# Altium schematic sheet LED-Driver-Sheet.SchDoc
size A4; DocumentNumber: 4; SheetNumber: 4; SheetTotal: 5
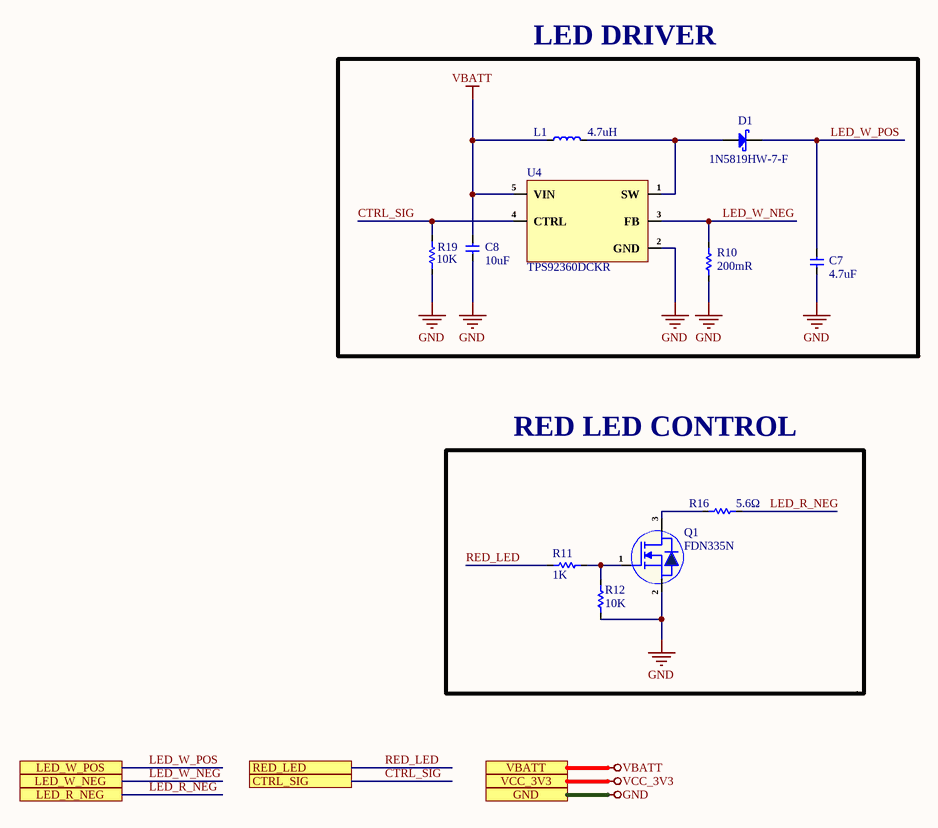
[diagram p0: LED-Driver-Sheet.SchDoc]

## Parts
C7  4.7uF  [Cap-0402]
C8  10uF  [Cap-0402]
D1  1N5819HW-7-F  [SOD-123]
L1  4.7uH  [IND-1210_]
Q1  FDN335N  [SOT-23]
R10  200mR  [Res-1206]
R11  1K  [Res-0402]
R12  10K  [Res-0402]
R16  5.6Ω  [Res-1206]
R19  10K  [Res-0402]
U4  TPS92360DCKR  [SC70-5]

## Blocks framed on the sheet
LED DRIVER: C7 C8 D1 L1 R10 R19 U4
RED LED CONTROL: Q1 R11 R12 R16

## Ports
CTRL_SIG (see Top-Sheet[3B], Controller-Sheet[1D]), GND (see Top-Sheet[2A], Connector-Sheet[2D], Controller-Sheet[2D], Power-Sheet[4C]), LED_R_NEG (see Top-Sheet[2B], Connector-Sheet[1D]), LED_W_NEG (see Top-Sheet[2B], Connector-Sheet[1D]), LED_W_POS (see Top-Sheet[2B], Connector-Sheet[1D]), RED_LED (see Top-Sheet[3B], Controller-Sheet[1D]), VBATT (see Top-Sheet[2A], Connector-Sheet[2D], Controller-Sheet[2D], Power-Sheet[4C]), VCC_3V3 (see Top-Sheet[2A], Controller-Sheet[2D], Power-Sheet[4C])

## Nets
GND: C7.1 C8.1 Q1.2(S) R10.1 R12.2 R19.1 U4.2(GND) ; port GND
VBATT: C8.2 L1.1 U4.5(VIN) ; port VBATT
VCC_3V3: port VCC_3V3
CTRL_SIG: R19.2 U4.4(CTRL) ; port CTRL_SIG
LED_R_NEG: R16.2 ; port LED_R_NEG
LED_W_NEG: R10.2 U4.3(FB) ; port LED_W_NEG
LED_W_POS: C7.2 D1.2(K) ; port LED_W_POS
RED_LED: R11.1 ; port RED_LED
NetD1_1: D1.1(A) L1.2 U4.1(SW)
NetQ1_1: Q1.1(G) R11.2 R12.1
NetQ1_3: Q1.3(D) R16.1

## Notes on the sheet
- File:
- Title:
- Date:
- Page
- Num:
- Total:
- Drawn By: Huzaifa Ali

## Library data of the parts
C7 = CL05A475MO5NUNC: CAP CER 4.7UF 16V X5R 0402; Manufacturer: Samsung; Material: 4241ConductorMaterial; Tolerance: 20%; Supplier 1: Avnet; Manufacturer Part Number: CL05A475MO5NUNC; RoHS: Yes; Category: Ceramic Capacitors; Stock 1: 50000; Pricing 1: 10000=0.09712 (USD); Mount: Surface Mount; Case/Package: 0402; Case Code (Metric): 1005; Case Code (Imperial): 0402; Min Operating Temperature: -55°C; Max Operating Temperature: 85°C; Packaging: Cut Tape; Capacitance: 4.7uF; Voltage Rating: 16V; Series: CL; Voltage Rating (DC): 16V; Length: 0.039inch; Width: 0.02inch; Height: 550um; Thickness: 0.022inch; RoHS Compliant: Yes; ComponentLink1URL: http://www.farnell.com/datasheets/2710653.pdf?src-supplier=Farnell; ComponentLink1Description: http://www.farnell.com/datasheets/2710653.pdf?src-supplier=Farnell; ComponentLink2URL: http://www.samsungsem.com/kr/support/product-search/mlcc/CL05A475MO5NUNC.jsp?src-supplier=Digikey; ComponentLink2Description: http://www.samsungsem.com/kr/support/product-search/mlcc/CL05A475MO5NUNC.jsp?src-supplier=Digikey; ComponentLink3URL: http://www.farnell.com/datasheets/2710653.pdf?src-supplier=Element14; ComponentLink3Description: http://www.farnell.com/datasheets/2710653.pdf?src-supplier=Element14; ComponentLink4URL: https://datasheet.octopart.com/CL05A475MO5NUNC-Samsung-Electro-Mechanics-datasheet-123102911.pdf?src-supplier=Future+Electronics; ComponentLink4Description: https://datasheet.octopart.com/CL05A475MO5NUNC-Samsung-Electro-Mechanics-datasheet-123102911.pdf?src-supplier=Future+Electronics; ComponentLink5URL: http://www.farnell.com/datasheets/2710653.pdf?src-supplier=Newark; ComponentLink5Description: http://www.farnell.com/datasheets/2710653.pdf?src-supplier=Newark; Supplier Part Number 1: CL05A475MO5NUNC
C8 = CL05A106MP5NUNC: CAP CER 10UF 10V X5R 0402; Manufacturer: Samsung; Tolerance: 20%; Item Type: Capacitor; Supplier 1: Avnet; Manufacturer Part Number: CL05A106MP5NUNC; RoHS: Yes; Category: Ceramic Capacitors; Stock 1: 1729850; Pricing 1: 10000=0.02537 (USD); Mount: Surface Mount; Case/Package: 0402; Case Code (Metric): 1005; Case Code (Imperial): 0402; Contact Plating: Tin; Min Operating Temperature: -55°C; Max Operating Temperature: 85°C; Package Quantity: 1; Packaging: Tape and Reel; Capacitance: 10uF; Voltage Rating: 10V; Dielectric: X5R; Termination: Wraparound; Series: CL; Construction: Flat; Length: 1mm; Width: 0.02inch; Thickness: 0.028inch; Depth: 0.5mm; Radiation Hardening: No; Lead Free: Lead Free; RoHS Compliant: Yes; ComponentLink1URL: https://datasheet.ciiva.com/25721/cl05a106mp5nunc-25721584.pdf?src-supplier=Digi-Key; ComponentLink1Description: https://datasheet.ciiva.com/25721/cl05a106mp5nunc-25721584.pdf?src-supplier=Digi-Key; ComponentLink2URL: https://datasheet.ciiva.com/26838/getdatasheetpartid-745310-26838170.pdf?src-supplier=Verical; ComponentLink2Description: https://datasheet.ciiva.com/26838/getdatasheetpartid-745310-26838170.pdf?src-supplier=Verical; Supplier Part Number 1: CL05A106MP5NUNC; LCSC Part Number: C315248
D1 = 1N5819HW-7-F: DIODE SCHOTTKY 40V 1A SOD123; Manufacturer: Diodes; Forward Voltage: 450mV; Max Reverse Current: 50uA; Element Configuration: Single; Max Forward Surge Current (Ifsm): 25A; Max Power Dissipation: 450mW; Polarity: Standard; Capacitance: 110pF; Supplier 1: Digi-Key; Manufacturer Part Number: 1N5819HW-7-F; RoHS: Yes; Category: Schottky Diodes; Pricing 1: 1=0.46000, 10=0.34500, 100=0.19530, 500=0.12936, 1000=0.09918 (USD); Case/Package: SOD-123-2; Number of Pins: 2; Weight: 0.000353oz; Contact Plating: Tin,Matte; Min Operating Temperature: -65°C; Max Operating Temperature: 125°C; Forward Current: 1A; Max Repetitive Reverse Voltage (Vrrm): 40V; Packaging: Tape and Reel; Peak Non-Repetitive Surge Current: 25A; Package Quantity: 3000; Average Rectified Current: 1A; Termination: SMD/SMT; Voltage Rating (DC): 40V; Current Rating: 1A; Output Current: 1A; Max Reverse Voltage (DC): 40V; Series: -; Length: 2.85mm; Width: 1.7mm; Height: 1.25mm; Radiation Hardening: No; RoHS Compliant: Yes; REACH SVHC: No SVHC; Lead Free: Lead Free; ComponentLink1URL: https://datasheet.ciiva.com/16303/ds30217-16303296.pdf?src-supplier=Future+Electronics; ComponentLink1Description: https://datasheet.ciiva.com/16303/ds30217-16303296.pdf?src-supplier=Future+Electronics; ComponentLink2URL: https://datasheet.ciiva.com/27092/1538419-27092484.pdf?src-supplier=Jameco; ComponentLink2Description: https://datasheet.ciiva.com/27092/1538419-27092484.pdf?src-supplier=Jameco; ComponentLink3URL: https://datasheet.ciiva.com/912/ds30217-912801.pdf?src-supplier=Digi-Key; ComponentLink3Description: https://datasheet.ciiva.com/912/ds30217-912801.pdf?src-supplier=Digi-Key; ComponentLink4URL: https://datasheet.ciiva.com/1177/ds30217-1177089.pdf?src-supplier=Element14; ComponentLink4Description: https://datasheet.ciiva.com/1177/ds30217-1177089.pdf?src-supplier=Element14; ComponentLink5URL: https://datasheet.ciiva.com/912/ds30217-912802.pdf?src-supplier=Digi-Key; ComponentLink5Description: https://datasheet.ciiva.com/912/ds30217-912802.pdf?src-supplier=Digi-Key; ComponentLink6URL: https://datasheet.ciiva.com/912/ds30217-912803.pdf?src-supplier=Digi-Key; ComponentLink6Description: https://datasheet.ciiva.com/912/ds30217-912803.pdf?src-supplier=Digi-Key; ComponentLink7URL: https://datasheet.ciiva.com/8303/ds30217-8303132.pdf?src-supplier=Avnet; ComponentLink7Description: https://datasheet.ciiva.com/8303/ds30217-8303132.pdf?src-supplier=Avnet; ComponentLink8URL: https://datasheet.ciiva.com/25919/ds30217-25919644.pdf?src-supplier=Avnet+Europe; ComponentLink8Description: https://datasheet.ciiva.com/25919/ds30217-25919644.pdf?src-supplier=Avnet+Europe; Supplier Part Number 1: 1N5819HW-FDICT-ND; LCSC Part Number: C82544; Item Type: Diode
L1 = DFE322512F-4R7M=P2: FIXED IND 4.7UH 1.6A 157MOHM SMD; Manufacturer: Murata; Item Type: Inductor; Supplier 1: Digi-Key; Manufacturer Part Number: DFE322512F-4R7M=P2; RoHS: Yes; Category: Fixed Inductors; Stock 1: 4687; Pricing 1: 1=0.61, 10=0.533, 25=0.4952, 50=0.4188, 100=0.3808, 250=0.35792, 500=0.31984, 1000=0.25892 (USD); RoHS Compliant: Yes; Supplier Part Number 1: 490-DFE322512F-4R7M=P2CT-ND; LCSC Part Number: C703083
Q1 = FDN335N: SOT-23 MOSFETs ROHS; Manufacturer: onsemi; Item Type: Mosfet; Manufacturer Part Number: FDN335N; Package: SOT-23; Digikey Part Number: FDN335NDKR-ND; ComponentLink1Description: Digikey Link; ComponentLink1URL: https://www.digikey.com/en/products/detail/onsemi/FDN335N/965301
R10 = PE1206FRF470R2L: RES 0.2 OHM 1% 1W 1206; Manufacturer: Yageo; Item Type: Resistors; Temperature Coefficient: 100ppm/°C; Supplier: Digikey; LCSC Part Number: C723709; Manufacturer Part Number: PE1206FRF470R2L; RoHS: Yes; Stock: 7734; Pricing: 1=0.63, 10=0.459, 25=0.368, 50=0.2732, 100=0.1927, 250=0.17164, 500=0.14714, 1000=0.1121 (USD); Case/Package: 340Case; Packaging: 10Packaging; Value: 200mR; RoHS Compliant: Yes
R11 = RC0402FR-071KL: 1 kOhms ±1% 0.063W, 1/16W Chip Resistor 0402 (1005 Metric) Moisture Resistant Thick Film; Manufacturer: YAGEO; Manufacturer Part Number: RC0402FR-071KL; Digikey Part Number: 311-1.00KLRDKR-ND; Item Type: Resistor; Package: 0402; ComponentLink1Description: Digikey Link; ComponentLink1URL: https://www.digikey.com/en/products/detail/yageo/RC0402FR-071KL/726513
R12 = RC0603FR-0710KL: 10 kOhms ±1% 0.063W, 1/16W Chip Resistor 0402 (1005 Metric) Moisture Resistant Thick Film; Manufacturer: YAGEO; Manufacturer Part Number: RC0402FR-0710KL; Digikey Part Number: 311-10.0KLRDKR-ND; Item Type: Resistor; Package: 0402; ComponentLink1Description: Digikey Link; ComponentLink1URL: https://www.digikey.com/en/products/detail/yageo/RC0402FR-0710KL/726523
R16 = RC1206FR-075R6L: RES 5.6 OHM 1% 1/4W 1206; Manufacturer: Yageo; Item Type: Resistor; Voltage Rating (AC): 200V; Supplier: Future Electronics; LCSC Part Number: C137246; Manufacturer Part Number: RC1206FR-075R6L; RoHS: Yes; Stock: 50000; Pricing: 5000=0.0109, 25000=0.0104, 100000=0.0098, 250000=0.0095, 625000=0.009 (USD); ComponentLink1URL: https://datasheet.ciiva.com/11808/0900766b80c6630a-11808968.pdf?src-supplier=Rs; ComponentLink1Description: https://datasheet.ciiva.com/11808/0900766b80c6630a-11808968.pdf?src-supplier=Rs; ComponentLink2URL: https://datasheet.ciiva.com/7857/444357-7857382.pdf?src-supplier=Element14; ComponentLink2Description: https://datasheet.ciiva.com/7857/444357-7857382.pdf?src-supplier=Element14; ComponentLink3URL: https://datasheet.ciiva.com/7857/444357-7857383.pdf?src-supplier=Element14; ComponentLink3Description: https://datasheet.ciiva.com/7857/444357-7857383.pdf?src-supplier=Element14; ComponentLink4URL: https://datasheet.ciiva.com/17422/pyu-rc1206-51-rohs-l-4-17422485.pdf?src-supplier=Future+Electronics; ComponentLink4Description: https://datasheet.ciiva.com/17422/pyu-rc1206-51-rohs-l-4-17422485.pdf?src-supplier=Future+Electronics
R19 = RT0402BRD0710KL: RES SMD 10K OHM 0.1% 1/16W 0402; Manufacturer: Yageo; Item Type: Resistor; Supplier: Future Electronics; Supplier Part Number: 1236728; Manufacturer Part Number: RT0402BRD0710KL; RoHS: Yes; Category: Chip SMD Resistors; Stock: 490000; Pricing: 10000=0.0218, 20000=0.0213, 30000=0.021, 50000=0.0206, 100000=0.0199 (USD); ComponentLink1URL: https://datasheet.ciiva.com/12836/pyu-rt-1-to-0-05-rohs-l-4-12836454.pdf?src-supplier=Mouser; ComponentLink1Description: https://datasheet.ciiva.com/12836/pyu-rt-1-to-0-05-rohs-l-4-12836454.pdf?src-supplier=Mouser; LCSC Part Number: C190095
U4 = TPS92360DCKR: IC LED DRV RGLTR PWM 1.2A SC70-5; Manufacturer: Texas Instruments; Supplier: Digikey; LCSC Part Number: C2928788; Manufacturer Part Number: TPS92360DCKR; RoHS: No; Item Type: IC; Stock: 4572; Pricing: 1=0.91, 10=0.817, 25=0.7748, 100=0.6366, 250=0.59508, 500=0.52588, 1000=0.41517 (USD)